# Altium schematic sheet Top-Sheet.SchDoc
size 420 x 297 mm; SheetNumber: 1; SheetTotal: 9
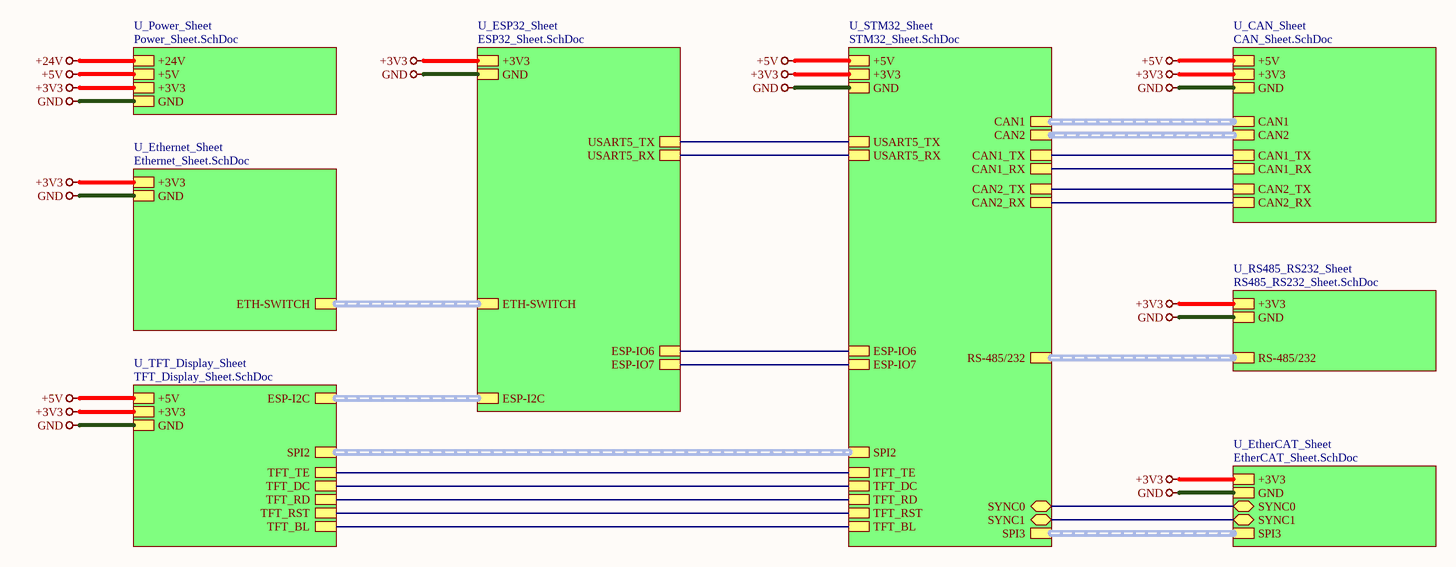
[diagram p0: Top-Sheet.SchDoc]

## Sub-sheets
U_CAN_Sheet = CAN_Sheet.SchDoc: CAN1 (harness CAN1), CAN2_RX, CAN2_TX, +5V, +3V3, GND, CAN1_RX, CAN1_TX, CAN2 (harness CAN2)
U_ESP32_Sheet = ESP32_Sheet.SchDoc: +3V3, GND, USART5_TX, USART5_RX, ESP-IO6, ESP-IO7, ESP-I2C (harness ESP-I2C), ETH-SWITCH (harness ETH-SWITCH)
U_EtherCAT_Sheet = EtherCAT_Sheet.SchDoc: +3V3, GND, SYNC0 (bidir), SYNC1 (bidir), SPI3 (harness SPI3)
U_Ethernet_Sheet = Ethernet_Sheet.SchDoc: +3V3, GND, ETH-SWITCH (harness ETH-SWITCH)
U_Power_Sheet = Power_Sheet.SchDoc: +24V, +5V, +3V3, GND
U_RS485_RS232_Sheet = RS485_RS232_Sheet.SchDoc: RS-485/232 (harness RS-485/232), +3V3, GND
U_STM32_Sheet = STM32_Sheet.SchDoc: USART5_TX, USART5_RX, CAN1 (harness CAN1), CAN2_RX, CAN2_TX, +5V, +3V3, GND, CAN1_RX, CAN1_TX, CAN2 (harness CAN2), SYNC0 (bidir), SYNC1 (bidir), SPI3 (harness SPI3), SPI2 (harness SPI2), ESP-IO6, ESP-IO7, TFT_TE, TFT_DC, TFT_RD, TFT_RST, RS-485/232 (harness RS-485/232), TFT_BL
U_TFT_Display_Sheet = TFT_Display_Sheet.SchDoc: +3V3, GND, +5V, ESP-I2C (harness ESP-I2C), SPI2 (harness SPI2), TFT_TE, TFT_DC, TFT_RD, TFT_RST, TFT_BL

## Nets
+3V3: sheet U_Power_Sheet/+3V3, sheet U_ESP32_Sheet/+3V3, sheet U_CAN_Sheet/+3V3, sheet U_RS485_RS232_Sheet/+3V3, sheet U_TFT_Display_Sheet/+3V3, sheet U_STM32_Sheet/+3V3, sheet U_EtherCAT_Sheet/+3V3, sheet U_Ethernet_Sheet/+3V3
+5V: sheet U_Power_Sheet/+5V, sheet U_CAN_Sheet/+5V, sheet U_TFT_Display_Sheet/+5V, sheet U_STM32_Sheet/+5V
+24V: sheet U_Power_Sheet/+24V
GND: sheet U_Power_Sheet/GND, sheet U_ESP32_Sheet/GND, sheet U_CAN_Sheet/GND, sheet U_RS485_RS232_Sheet/GND, sheet U_TFT_Display_Sheet/GND, sheet U_STM32_Sheet/GND, sheet U_EtherCAT_Sheet/GND, sheet U_Ethernet_Sheet/GND
(unnamed): sheet U_ESP32_Sheet/USART5_TX, sheet U_STM32_Sheet/USART5_TX
(unnamed): sheet U_ESP32_Sheet/USART5_RX, sheet U_STM32_Sheet/USART5_RX
(unnamed): sheet U_ESP32_Sheet/ESP-IO6, sheet U_STM32_Sheet/ESP-IO6
(unnamed): sheet U_ESP32_Sheet/ESP-IO7, sheet U_STM32_Sheet/ESP-IO7
(unnamed): sheet U_CAN_Sheet/CAN2_RX, sheet U_STM32_Sheet/CAN2_RX
(unnamed): sheet U_CAN_Sheet/CAN2_TX, sheet U_STM32_Sheet/CAN2_TX
(unnamed): sheet U_CAN_Sheet/CAN1_RX, sheet U_STM32_Sheet/CAN1_RX
(unnamed): sheet U_CAN_Sheet/CAN1_TX, sheet U_STM32_Sheet/CAN1_TX
(unnamed): sheet U_TFT_Display_Sheet/TFT_TE, sheet U_STM32_Sheet/TFT_TE
(unnamed): sheet U_TFT_Display_Sheet/TFT_DC, sheet U_STM32_Sheet/TFT_DC
(unnamed): sheet U_TFT_Display_Sheet/TFT_RD, sheet U_STM32_Sheet/TFT_RD
(unnamed): sheet U_TFT_Display_Sheet/TFT_RST, sheet U_STM32_Sheet/TFT_RST
(unnamed): sheet U_TFT_Display_Sheet/TFT_BL, sheet U_STM32_Sheet/TFT_BL
(unnamed): sheet U_STM32_Sheet/SYNC0, sheet U_EtherCAT_Sheet/SYNC0
(unnamed): sheet U_STM32_Sheet/SYNC1, sheet U_EtherCAT_Sheet/SYNC1

## Buses and harness runs
harness sheet U_CAN_Sheet/CAN1 = sheet U_STM32_Sheet/CAN1
harness sheet U_CAN_Sheet/CAN2 = sheet U_STM32_Sheet/CAN2
harness sheet U_ESP32_Sheet/ESP-I2C = sheet U_TFT_Display_Sheet/ESP-I2C
harness sheet U_ESP32_Sheet/ETH-SWITCH = sheet U_Ethernet_Sheet/ETH-SWITCH
harness sheet U_EtherCAT_Sheet/SPI3 = sheet U_STM32_Sheet/SPI3
harness sheet U_RS485_RS232_Sheet/RS-485/232 = sheet U_STM32_Sheet/RS-485/232
harness sheet U_STM32_Sheet/SPI2 = sheet U_TFT_Display_Sheet/SPI2

## Notes on the sheet
- File:
- Title:
- Date:
- Page
- Num:
- Total:
- Drawn By: Huzaifa Ali